# Altium project Electrode_Board_v3.1.PrjPcb
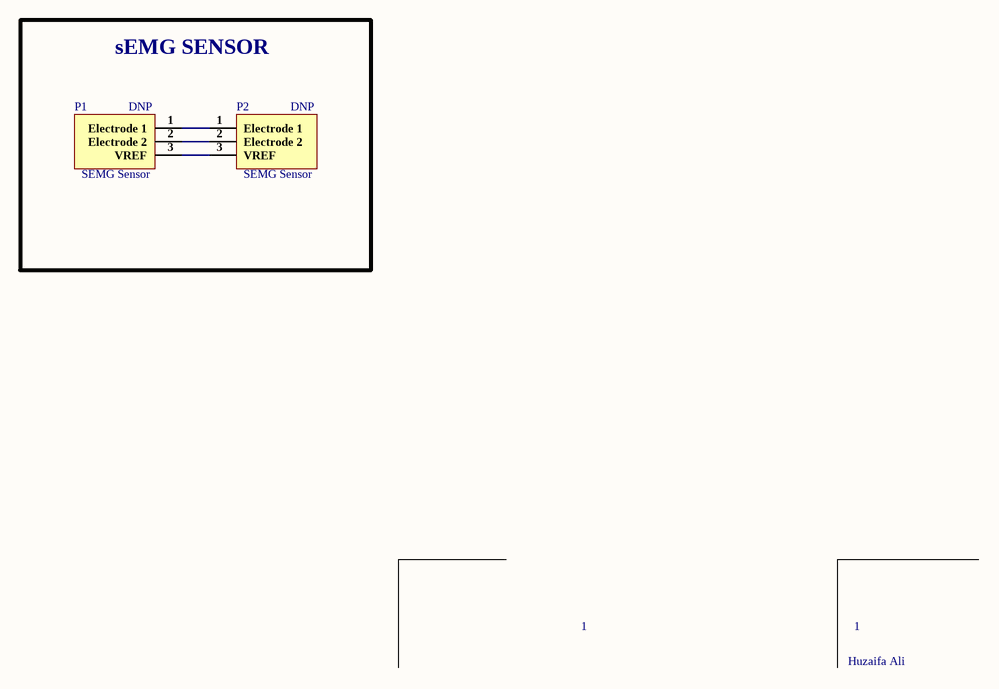
[diagram p0: OpAmp_Sheet.SchDoc]
1 sheet, 2 parts. Net scope: global (net labels, ports and power ports of the same name join across sheets).
Board file: Electrode_Board_v3.1.PcbDoc

## Sheet OpAmp_Sheet.SchDoc: =Projectname
size A4; DocumentNumber: 1; SheetNumber: 1; SheetTotal: 1

### Parts
P1  DNP  [sEMG-sensor]
P2  DNP  [sEMG-sensor]

### Blocks framed on the sheet
sEMG SENSOR: P1 P2

### Nets
NetP1_1: P1.1(Electrode_1) P2.1(Electrode_1)
NetP1_2: P1.2(Electrode_2) P2.2(Electrode_2)
NetP1_3: P1.3(VREF) P2.3(VREF)

### Notes on the sheet
- (near P1) SEMG Sensor
- (near P2) SEMG Sensor
- 1
- Huzaifa Ali

### Library data of the parts
P1 P2 = SEMG Sensor: Sensor Connecting Pads